# Altium schematic sheet USB 2.0 Hub.SchDoc: USB 2.0 Hub
size A2; DocumentNumber: 5; SheetNumber: 5; SheetTotal: 9
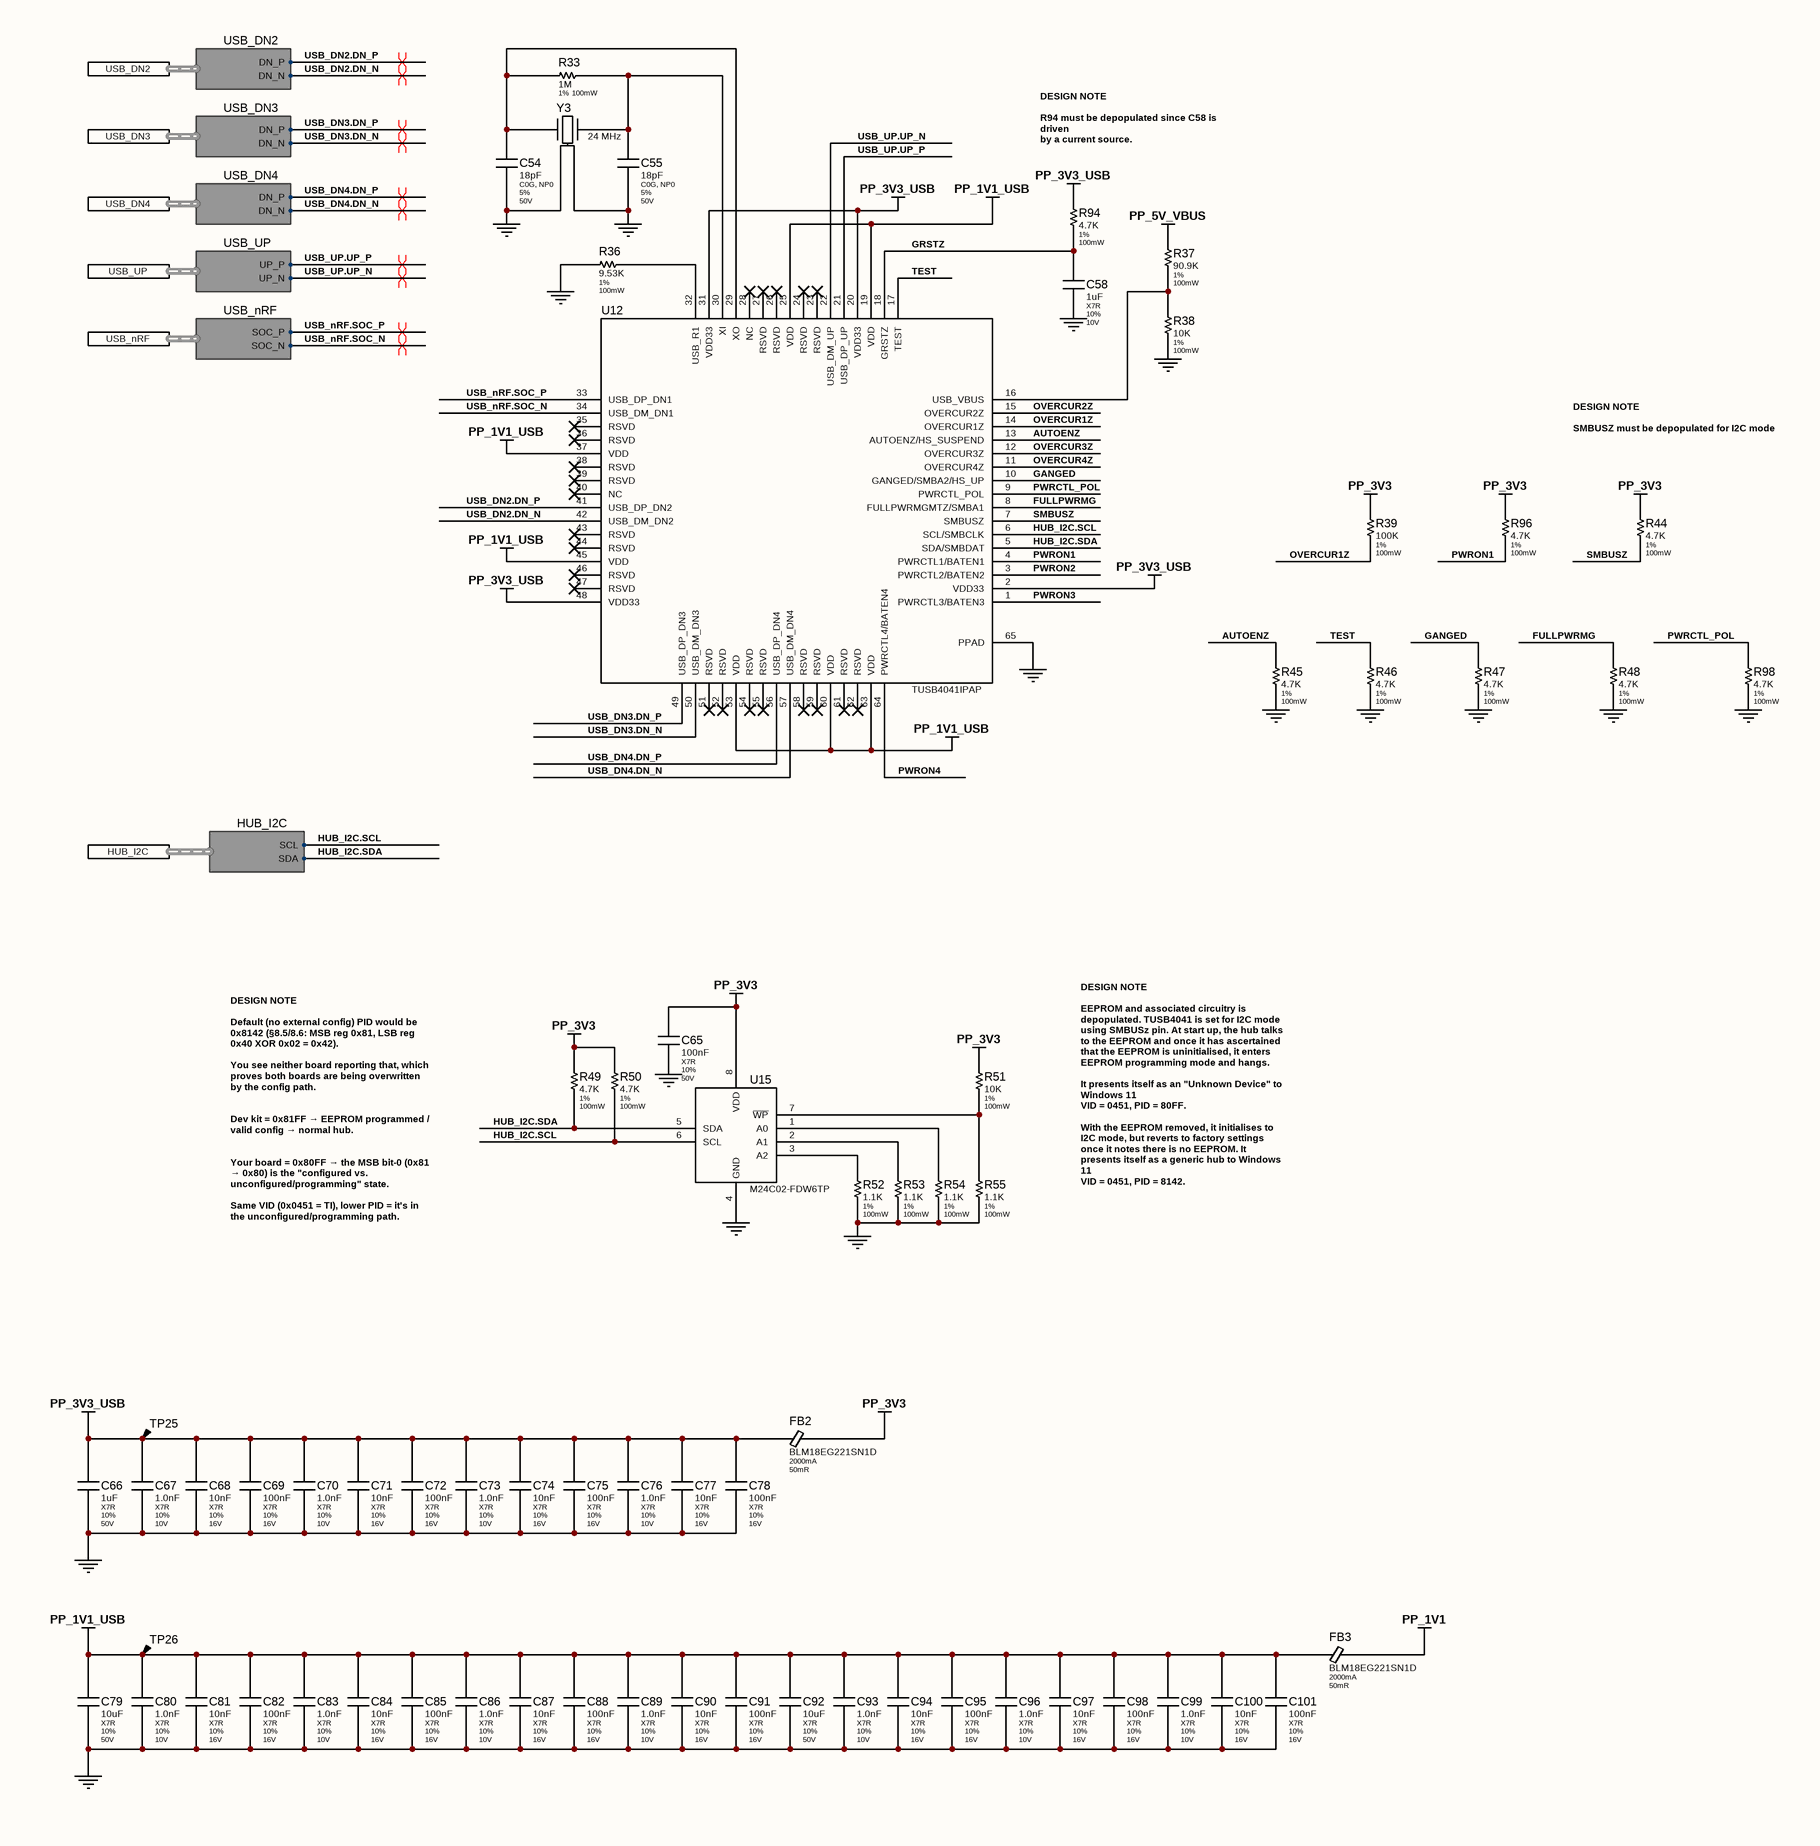
[diagram p0: USB 2.0 Hub.SchDoc, left]
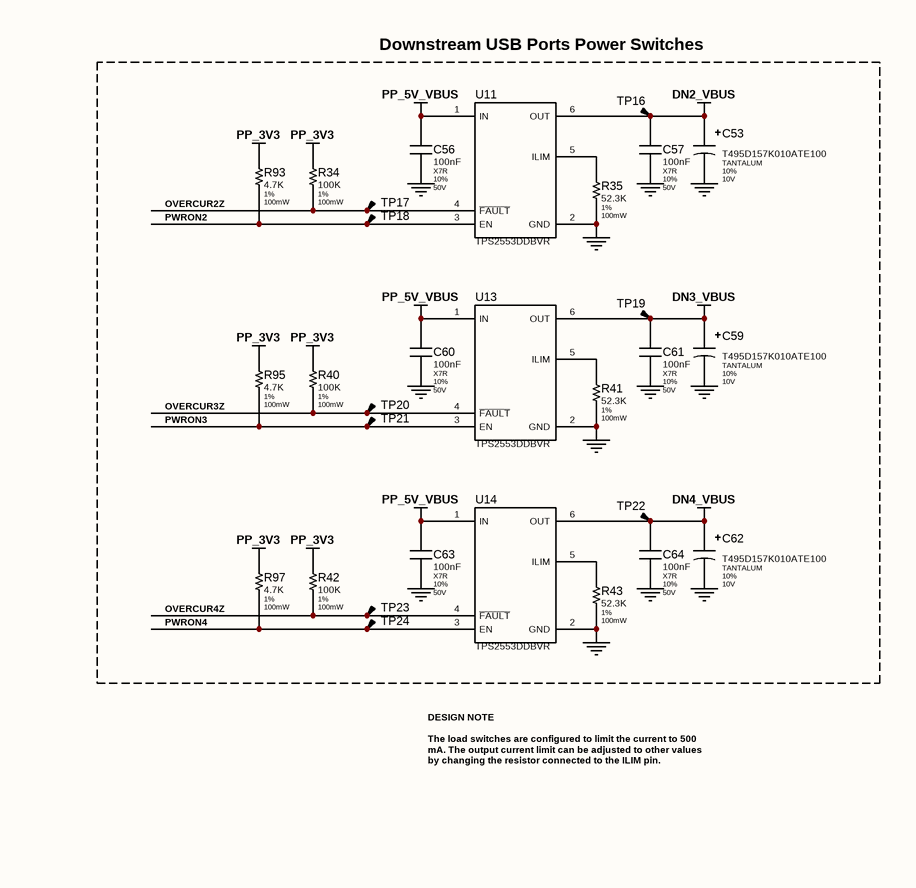
[diagram p1: USB 2.0 Hub.SchDoc, right]

## Parts
C53  T495D157K010ATE100  Type: TANTALUM  Tolerance: 10%  Voltage: 10V  [T495D]
C54  18pF  Dielectric: C0G, NP0  Tolerance: 5%  Voltage: 50V  [MLCC-0402-N]
C55  18pF  Dielectric: C0G, NP0  Tolerance: 5%  Voltage: 50V  [MLCC-0402-N]
C56  100nF  Dielectric: X7R  Tolerance: 10%  Voltage: 50V  [MLCC-0402-N]
C57  100nF  Dielectric: X7R  Tolerance: 10%  Voltage: 50V  [MLCC-0402-N]
C58  1uF  Dielectric: X7R  Tolerance: 10%  Voltage: 10V  [MLCC-0402-N]
C59  T495D157K010ATE100  Type: TANTALUM  Tolerance: 10%  Voltage: 10V  [T495D]
C60  100nF  Dielectric: X7R  Tolerance: 10%  Voltage: 50V  [MLCC-0402-N]
C61  100nF  Dielectric: X7R  Tolerance: 10%  Voltage: 50V  [MLCC-0402-N]
C62  T495D157K010ATE100  Type: TANTALUM  Tolerance: 10%  Voltage: 10V  [T495D]
C63  100nF  Dielectric: X7R  Tolerance: 10%  Voltage: 50V  [MLCC-0402-N]
C64  100nF  Dielectric: X7R  Tolerance: 10%  Voltage: 50V  [MLCC-0402-N]
C65  100nF  Dielectric: X7R  Tolerance: 10%  Voltage: 50V  [MLCC-0402-N]
C66  1uF  Dielectric: X7R  Tolerance: 10%  Voltage: 50V  [MLCC-0805-N]
C67  1.0nF  Dielectric: X7R  Tolerance: 10%  Voltage: 10V  [MLCC-0201-N]
C68  10nF  Dielectric: X7R  Tolerance: 10%  Voltage: 16V  [MLCC-0201-N]
C69  100nF  Dielectric: X7R  Tolerance: 10%  Voltage: 16V  [MLCC-0201-N]
C70  1.0nF  Dielectric: X7R  Tolerance: 10%  Voltage: 10V  [MLCC-0201-N]
C71  10nF  Dielectric: X7R  Tolerance: 10%  Voltage: 16V  [MLCC-0201-N]
C72  100nF  Dielectric: X7R  Tolerance: 10%  Voltage: 16V  [MLCC-0201-N]
C73  1.0nF  Dielectric: X7R  Tolerance: 10%  Voltage: 10V  [MLCC-0201-N]
C74  10nF  Dielectric: X7R  Tolerance: 10%  Voltage: 16V  [MLCC-0201-N]
C75  100nF  Dielectric: X7R  Tolerance: 10%  Voltage: 16V  [MLCC-0201-N]
C76  1.0nF  Dielectric: X7R  Tolerance: 10%  Voltage: 10V  [MLCC-0201-N]
C77  10nF  Dielectric: X7R  Tolerance: 10%  Voltage: 16V  [MLCC-0201-N]
C78  100nF  Dielectric: X7R  Tolerance: 10%  Voltage: 16V  [MLCC-0201-N]
C79  10uF  Dielectric: X7R  Tolerance: 10%  Voltage: 50V  [MLCC-1206-N]
C80  1.0nF  Dielectric: X7R  Tolerance: 10%  Voltage: 10V  [MLCC-0201-N]
C81  10nF  Dielectric: X7R  Tolerance: 10%  Voltage: 16V  [MLCC-0201-N]
C82  100nF  Dielectric: X7R  Tolerance: 10%  Voltage: 16V  [MLCC-0201-N]
C83  1.0nF  Dielectric: X7R  Tolerance: 10%  Voltage: 10V  [MLCC-0201-N]
C84  10nF  Dielectric: X7R  Tolerance: 10%  Voltage: 16V  [MLCC-0201-N]
C85  100nF  Dielectric: X7R  Tolerance: 10%  Voltage: 16V  [MLCC-0201-N]
C86  1.0nF  Dielectric: X7R  Tolerance: 10%  Voltage: 10V  [MLCC-0201-N]
C87  10nF  Dielectric: X7R  Tolerance: 10%  Voltage: 16V  [MLCC-0201-N]
C88  100nF  Dielectric: X7R  Tolerance: 10%  Voltage: 16V  [MLCC-0201-N]
C89  1.0nF  Dielectric: X7R  Tolerance: 10%  Voltage: 10V  [MLCC-0201-N]
C90  10nF  Dielectric: X7R  Tolerance: 10%  Voltage: 16V  [MLCC-0201-N]
C91  100nF  Dielectric: X7R  Tolerance: 10%  Voltage: 16V  [MLCC-0201-N]
C92  10uF  Dielectric: X7R  Tolerance: 10%  Voltage: 50V  [MLCC-1206-N]
C93  1.0nF  Dielectric: X7R  Tolerance: 10%  Voltage: 10V  [MLCC-0201-N]
C94  10nF  Dielectric: X7R  Tolerance: 10%  Voltage: 16V  [MLCC-0201-N]
C95  100nF  Dielectric: X7R  Tolerance: 10%  Voltage: 16V  [MLCC-0201-N]
C96  1.0nF  Dielectric: X7R  Tolerance: 10%  Voltage: 10V  [MLCC-0201-N]
C97  10nF  Dielectric: X7R  Tolerance: 10%  Voltage: 16V  [MLCC-0201-N]
C98  100nF  Dielectric: X7R  Tolerance: 10%  Voltage: 16V  [MLCC-0201-N]
C99  1.0nF  Dielectric: X7R  Tolerance: 10%  Voltage: 10V  [MLCC-0201-N]
C100  10nF  Dielectric: X7R  Tolerance: 10%  Voltage: 16V  [MLCC-0201-N]
C101  100nF  Dielectric: X7R  Tolerance: 10%  Voltage: 16V  [MLCC-0201-N]
FB2  BLM18EG221SN1D  Current: 2000mA  ESR: 50mR  [FB-0603-N]
FB3  BLM18EG221SN1D  Current: 2000mA  ESR: 50mR  [FB-0603-N]
R33  1M  Tolerance: 1%  Power: 100mW  [RES-0402-N]
R34  100K  Tolerance: 1%  Power: 100mW  [RES-0402-N]
R35  52.3K  Tolerance: 1%  Power: 100mW  [RES-0402-N]
R36  9.53K  Tolerance: 1%  Power: 100mW  [RES-0402-N]
R37  90.9K  Tolerance: 1%  Power: 100mW  [RES-0402-N]
R38  10K  Tolerance: 1%  Power: 100mW  [RES-0402-N]
R39  100K  Tolerance: 1%  Power: 100mW  [RES-0402-N]
R40  100K  Tolerance: 1%  Power: 100mW  [RES-0402-N]
R41  52.3K  Tolerance: 1%  Power: 100mW  [RES-0402-N]
R42  100K  Tolerance: 1%  Power: 100mW  [RES-0402-N]
R43  52.3K  Tolerance: 1%  Power: 100mW  [RES-0402-N]
R44  4.7K  Tolerance: 1%  Power: 100mW  [RES-0402-N]
R45  4.7K  Tolerance: 1%  Power: 100mW  [RES-0402-N]
R46  4.7K  Tolerance: 1%  Power: 100mW  [RES-0402-N]
R47  4.7K  Tolerance: 1%  Power: 100mW  [RES-0402-N]
R48  4.7K  Tolerance: 1%  Power: 100mW  [RES-0402-N]
R49  4.7K  Tolerance: 1%  Power: 100mW  [RES-0402-N]
R50  4.7K  Tolerance: 1%  Power: 100mW  [RES-0402-N]
R51  10K  Tolerance: 1%  Power: 100mW  [RES-0402-N]
R52  1.1K  Tolerance: 1%  Power: 100mW  [RES-0402-N]
R53  1.1K  Tolerance: 1%  Power: 100mW  [RES-0402-N]
R54  1.1K  Tolerance: 1%  Power: 100mW  [RES-0402-N]
R55  1.1K  Tolerance: 1%  Power: 100mW  [RES-0402-N]  (no BOM)
R93  4.7K  Tolerance: 1%  Power: 100mW  [RES-0402-N]
R94  4.7K  Tolerance: 1%  Power: 100mW  [RES-0402-N]  (no BOM)
R95  4.7K  Tolerance: 1%  Power: 100mW  [RES-0402-N]
R96  4.7K  Tolerance: 1%  Power: 100mW  [RES-0402-N]
R97  4.7K  Tolerance: 1%  Power: 100mW  [RES-0402-N]
R98  4.7K  Tolerance: 1%  Power: 100mW  [RES-0402-N]  (no BOM)
TP16  TP-SMT-CIRCLE  [TP-1.0mm]  (value not drawn)  (no BOM)
TP17  TP-SMT-CIRCLE  [TP-1.0mm]  (value not drawn)  (no BOM)
TP18  TP-SMT-CIRCLE  [TP-1.0mm]  (value not drawn)  (no BOM)
TP19  TP-SMT-CIRCLE  [TP-1.0mm]  (value not drawn)  (no BOM)
TP20  TP-SMT-CIRCLE  [TP-1.0mm]  (value not drawn)  (no BOM)
TP21  TP-SMT-CIRCLE  [TP-1.0mm]  (value not drawn)  (no BOM)
TP22  TP-SMT-CIRCLE  [TP-1.0mm]  (value not drawn)  (no BOM)
TP23  TP-SMT-CIRCLE  [TP-1.0mm]  (value not drawn)  (no BOM)
TP24  TP-SMT-CIRCLE  [TP-1.0mm]  (value not drawn)  (no BOM)
TP25  TP-SMT-CIRCLE  [TP-1.0mm]  (value not drawn)  (no BOM)
TP26  TP-SMT-CIRCLE  [TP-1.0mm]  (value not drawn)  (no BOM)
U11  TPS2553DDBVR  [SOT95P280X145-6N]
U12  TUSB4041IPAP  [PAP0064M]
U13  TPS2553DDBVR  [SOT95P280X145-6N]
U14  TPS2553DDBVR  [SOT95P280X145-6N]
U15  M24C02-FDW6TP  [TSSOP-8-N]
Y3  24 MHz  [XTAL-5.0x3.2-ECS]

## Blocks framed on the sheet
Downstream USB Ports Power Switches: C53 C56 C57 C59-C64 R34 R35 R40-R43 R93 R95 R97 TP16-TP24 U11 U13 U14

## Ports
HUB_I2C (harness HUB_I2C), USB_DN2 (harness USB_DN2), USB_DN3 (harness USB_DN3), USB_DN4 (harness USB_DN4), USB_nRF (harness USB_nRF), USB_UP (harness USB_UP)

## Harnesses
USB_DN2: DN_P, DN_N
USB_DN3: DN_P, DN_N
USB_DN4: DN_P, DN_N
USB_UP: UP_P, UP_N
USB_nRF: SOC_P, SOC_N
HUB_I2C: SCL, SDA

## Nets
DN2_VBUS: C53.1 C57.1 TP16.1 U11.6(OUT)
DN3_VBUS: C59.1 C61.1 TP19.1 U13.6(OUT)
DN4_VBUS: C62.1 C64.1 TP22.1 U14.6(OUT)
GND: C53.2 C54.2 C55.2 C56.2 C57.2 C58.2 C59.2 C60.2 C61.2 C62.2 C63.2 C64.2 C65.2 C66.2 C67.2 C68.2 C69.2 C70.2 C71.2 C72.2 C73.2 C74.2 C75.2 C76.2 C77.2 C78.2 C79.2 C80.2 C81.2 C82.2 C83.2 C84.2 C85.2 C86.2 C87.2 C88.2 C89.2 C90.2 C91.2 C92.2 C93.2 C94.2 C95.2 C96.2 C97.2 C98.2 C99.2 C100.2 C101.2 R35.2 R36.1 R38.2 R41.2 R43.2 R45.2 R46.2 R47.2 R48.2 R52.2 R53.2 R54.2 R55.2 R98.2 U11.2(GND) U12.65(PPAD) U13.2(GND) U14.2(GND) U15.4(GND) Y3.2 Y3.4
PP_1V1: FB3.2
PP_1V1_USB: C79.1 C80.1 C81.1 C82.1 C83.1 C84.1 C85.1 C86.1 C87.1 C88.1 C89.1 C90.1 C91.1 C92.1 C93.1 C94.1 C95.1 C96.1 C97.1 C98.1 C99.1 C100.1 C101.1 FB3.1 TP26.1 U12.19(VDD) U12.25(VDD) U12.37(VDD) U12.45(VDD) U12.53(VDD) U12.60(VDD) U12.63(VDD)
PP_3V3: C65.1 FB2.2 R34.1 R39.1 R40.1 R42.1 R44.1 R49.1 R50.1 R51.1 R93.1 R95.1 R96.1 R97.1 U15.8(VDD)
PP_3V3_USB: C66.1 C67.1 C68.1 C69.1 C70.1 C71.1 C72.1 C73.1 C74.1 C75.1 C76.1 C77.1 C78.1 FB2.1 R94.1 TP25.1 U12.2(VDD33) U12.20(VDD33) U12.31(VDD33) U12.48(VDD33)
PP_5V_VBUS: C56.1 C60.1 C63.1 R37.2 U11.1(IN) U13.1(IN) U14.1(IN)
AUTOENZ: R45.1 U12.13(AUTOENZ/HS_SUSPEND)
FULLPWRMG: R48.1 U12.8(FULLPWRMGMTZ/SMBA1)
GANGED: R47.1 U12.10(GANGED/SMBA2/HS_UP)
GRSTZ: C58.1 R94.2 U12.18(GRSTZ)
HUB_I2C.SCL: R50.2 U12.6(SCL/SMBCLK) U15.6(SCL) ; port HUB_I2C.SCL
HUB_I2C.SDA: R49.2 U12.5(SDA/SMBDAT) U15.5(SDA) ; port HUB_I2C.SDA
OVERCUR1Z: R39.2 U12.14(OVERCUR1Z)
OVERCUR2Z: R34.2 TP17.1 U11.4(~{FAULT}) U12.15(OVERCUR2Z)
OVERCUR3Z: R40.2 TP20.1 U12.12(OVERCUR3Z) U13.4(~{FAULT})
OVERCUR4Z: R42.2 TP23.1 U12.11(OVERCUR4Z) U14.4(~{FAULT})
PWRCTL_POL: R98.1 U12.9(PWRCTL_POL)
PWRON1: R96.2 U12.4(PWRCTL1/BATEN1)
PWRON2: R93.2 TP18.1 U11.3(EN) U12.3(PWRCTL2/BATEN2)
PWRON3: R95.2 TP21.1 U12.1(PWRCTL3/BATEN3) U13.3(EN)
PWRON4: R97.2 TP24.1 U12.64(PWRCTL4/BATEN4) U14.3(EN)
SMBUSZ: R44.2 U12.7(SMBUSZ)
TEST: R46.1 U12.17(TEST)
USB_DN2.DN_N: U12.42(USB_DM_DN2) ; port USB_DN2.DN_N
USB_DN2.DN_P: U12.41(USB_DP_DN2) ; port USB_DN2.DN_P
USB_DN3.DN_N: U12.50(USB_DM_DN3) ; port USB_DN3.DN_N
USB_DN3.DN_P: U12.49(USB_DP_DN3) ; port USB_DN3.DN_P
USB_DN4.DN_N: U12.57(USB_DM_DN4) ; port USB_DN4.DN_N
USB_DN4.DN_P: U12.56(USB_DP_DN4) ; port USB_DN4.DN_P
USB_nRF.SOC_N: U12.34(USB_DM_DN1) ; port USB_nRF.SOC_N
USB_nRF.SOC_P: U12.33(USB_DP_DN1) ; port USB_nRF.SOC_P
USB_UP.UP_N: U12.22(USB_DM_UP) ; port USB_UP.UP_N
USB_UP.UP_P: U12.21(USB_DP_UP) ; port USB_UP.UP_P
NetC54_1: C54.1 R33.1 U12.29(XO) Y3.1
NetC55_1: C55.1 R33.2 U12.30(XI) Y3.3
NetR35_1: R35.1 U11.5(ILIM)
NetR36_2: R36.2 U12.32(USB_R1)
NetR37_1: R37.1 R38.1 U12.16(USB_VBUS)
NetR41_1: R41.1 U13.5(ILIM)
NetR43_1: R43.1 U14.5(ILIM)
NetR51_2: R51.2 R55.1 U15.7(~{WP})
NetR52_1: R52.1 U15.3(A2)
NetR53_1: R53.1 U15.2(A1)
NetR54_1: R54.1 U15.1(A0)

Not connected (* = marked no-connect by the designer): U12 23(RSVD)* 24(RSVD)* 26(RSVD)* 27(RSVD)* 28(NC)* 35(RSVD)* 36(RSVD)* 38(RSVD)* 39(RSVD)* 40(NC)* 43(RSVD)* 44(RSVD)* 46(RSVD)* 47(RSVD)* 51(RSVD)* 52(RSVD)* 54(RSVD)* 55(RSVD)* 58(RSVD)* 59(RSVD)* 61(RSVD)* 62(RSVD)*

## Layout directives
differential pair: USB_DN2.DN_N, USB_DN2.DN_P, USB_DN3.DN_N, USB_DN3.DN_P, USB_DN4.DN_N, USB_DN4.DN_P, USB_nRF.SOC_N, USB_nRF.SOC_P, USB_UP.UP_N, USB_UP.UP_P

## Notes on the sheet
- DESIGN NOTE
  R94 must be depopulated since C58 is driven
  by a current source.
- DESIGN NOTE
  SMBUSZ must be depopulated for I2C mode
- DESIGN NOTE
  The load switches are configured to limit the current to 500 mA. The output current limit can be adjusted to other values by changing the resistor connected to the ILIM pin.
- DESIGN NOTE
  Default (no external config) PID would be 0x8142 (§8.5/8.6: MSB reg 0x81, LSB reg 0x40 XOR 0x02 = 0x42).
  You see neither board reporting that, which proves both boards are being overwritten by the config path.
  Dev kit = 0x81FF → EEPROM programmed / valid config → normal hub.
  Your board = 0x80FF → the MSB bit‑0 (0x81 → 0x80) is the "configured vs. unconfigured/programming" state.
  Same VID (0x0451 = TI), lower PID = it's in the unconfigured/programming path.
- DESIGN NOTE
  EEPROM and associated circuitry is depopulated. TUSB4041 is set for I2C mode using SMBUSz pin. At start up, the hub talks to the EEPROM and once it has ascertained that the EEPROM is uninitialised, it enters EEPROM programming mode and hangs.
  It presents itself as an "Unknown Device" to Windows 11
  VID = 0451, PID = 80FF.
  With the EEPROM removed, it initialises to I2C mode, but reverts to factory settings once it notes there is no EEPROM. It presents itself as a generic hub to Windows 11
  VID = 0451, PID = 8142.
- THIS DOCUMENT IS UNCONTROLLED WHEN PRINTED
- COMMERCIAL IN CONFIDENCE
- CLIENT
- PROJECT
- PART NAME
- TITLE
- SHEET SIZE
- SHEET
- DATE
- A2
- FILE
- PROJECT CODE
- PART / DWG No.
- REV
- VARIANT
- AUTHOR

## Library data of the parts
C53 C59 C62 = CMP-0000003482-3: CAP-TANT-150uF-10V-10%-2917; Manufacturer: KEMET; Value: 150uF; Temperature (Min): -55; ESR: 100 mOhm; Temperature (Max): 125; ComponentLink1Description: Datasheet; ComponentLink1URL: https://yageogroup.com/content/datasheet/asset/file/KEM_T2009_T495; Manufacturer Part Number: T495D157K010ATE100
C54 C55 = CMP-0000000730-3: CAP-CER-18pF-50V-0402-NP0-5%; Value: 18pF
C56 C57 C60 C61 C63-C65 = CMP-0000000712-3: CAP-CER-100nF-50V-0402-X7R-10%; Value: 100nF
C58 = CMP-0000002778-1: CAP-CER-1uF-10V-0402-X7R-10%; Value: 1uF
C66 = CMP-0000001064-2: CAP-CER-1uF-50V-0805-X7R-10%; Value: 1uF
C67 C70 C73 C76 C80 C83 C86 C89 C93 C96 C99 = CMP-0000003428-2: CAP-CER-1.0nF-10V-0201-X7R-10%; Value: 1.0nF
C68 C71 C74 C77 C81 C84 C87 C90 C94 C97 C100 = CMP-0000003392-1: CAP-CER-10nF-16V-0201-X7R-10%; Value: 10nF
C69 C72 C75 C78 C82 C85 C88 C91 C95 C98 C101 = CMP-0000003381-1: CAP-CER-100nF-16V-0201-X7R-10%; Value: 100nF
C79 C92 = CMP-0000002231-1: CAP-CER-10uF-50V-1206-X7R-10%; Value: 10uF
FB2 FB3 = CMP-00084-3: FB-220R@100MHz-2000mA-50mR-BLM18EG221SN1D; Manufacturer: Murata Electronics; Value: 220 Ohms @ 100MHz; Tolerance: 25%; ComponentLink1Description: Datasheet; Manufacturer Part Number: BLM18EG221SN1D; ComponentLink1URL: https://www.murata.com/en-us/products/productdata/8796747366430/ENFA0021.pdf
R33 = CMP-0000001837-2: RES-1M-0402-1%-100mW; Value: 1M
R34 R39 R40 R42 = CMP-0000001723-1: RES-100K-0402-1%-100mW; Value: 100K
R35 R41 R43 = CMP-0000001691-1: RES-52.3K-0402-1%-100mW; Value: 52.3K
R36 = CMP-0000001607-1: RES-9.53K-0402-1%-100mW; Value: 9.53K
R37 = CMP-0000001718-1: RES-90.9K-0402-1%-100mW; Value: 90.9K
R38 R51 = CMP-0000001609-1: RES-10K-0402-1%-100mW; Value: 10K
R44-R50 R93-R98 = CMP-0000001571-1: RES-4.7K-0402-1%-100mW; Value: 4.7K
R52-R55 = CMP-0000001499-1: RES-1.1K-0402-1%-100mW; Value: 1.1K
TP16-TP26 = CMP-0000000822-22: Test Point, Circular SMT Style
U11 U13 U14 = CMP-0000003472-2: IC-PWRSWITCH-1.5A-TPS2553DDBVR; Manufacturer: Texas Instruments; ComponentLink1Description: Datasheet; Manufacturer Part Number: TPS2553DDBVR; ComponentLink1URL: https://www.ti.com/general/docs/suppproductinfo.tsp?distId=10&gotoUrl=https%3A%2F%2Fwww.ti.com%2Flit%2Fgpn%2Ftps2552d
U12 = CMP-0000003455-3: IC-INTERFACE-USB-HUB-TUSB4041IPAP; Manufacturer: Texas Instruments; Manufacturer Part Number: TUSB4041IPAP; ComponentLink1URL: https://www.ti.com/lit/gpn/tusb4041i; ComponentLink1Description: Datasheet
U15 = CMP-0000002330-2: IC-EEPROM-2KBIT-M24C02-FDW6TP; Manufacturer: STMicroelectronics; ComponentLink1URL: https://www.st.com/content/ccc/resource/technical/document/datasheet/b0/d8/50/40/5a/85/49/6f/DM00071904.pdf/files/DM00071904.pdf/jcr:content/translations/en.DM00071904.pdf; Manufacturer Part Number: M24C02-FDW6TP; ComponentLink1Description: Datasheet
Y3 = CMP-00287-2: XTAL-24MHz-50ppm-20pF-5.0x3.2; Manufacturer: ECS Inc.; Manufacturer Part Number: ECS-240-20-30B-TR; Stability: ±50ppm; Load Capacitance: 20pF; Tolerance: ±10ppm; Value: 24 MHz